# EasyEDA Pro project ProProject_ESP32C3-1.54墨水屏-多功能_2024-05-25.epro, schematic Schematic1
Create Date: 2024-04-17; Page Name: P1; Project Name: ESP32C3-1.54墨水屏-多功能; Schematic Name: Schematic1; Update Date: 2024-04-27; Company: 嘉立创EDA; Page Size: A4; Version: V1.0
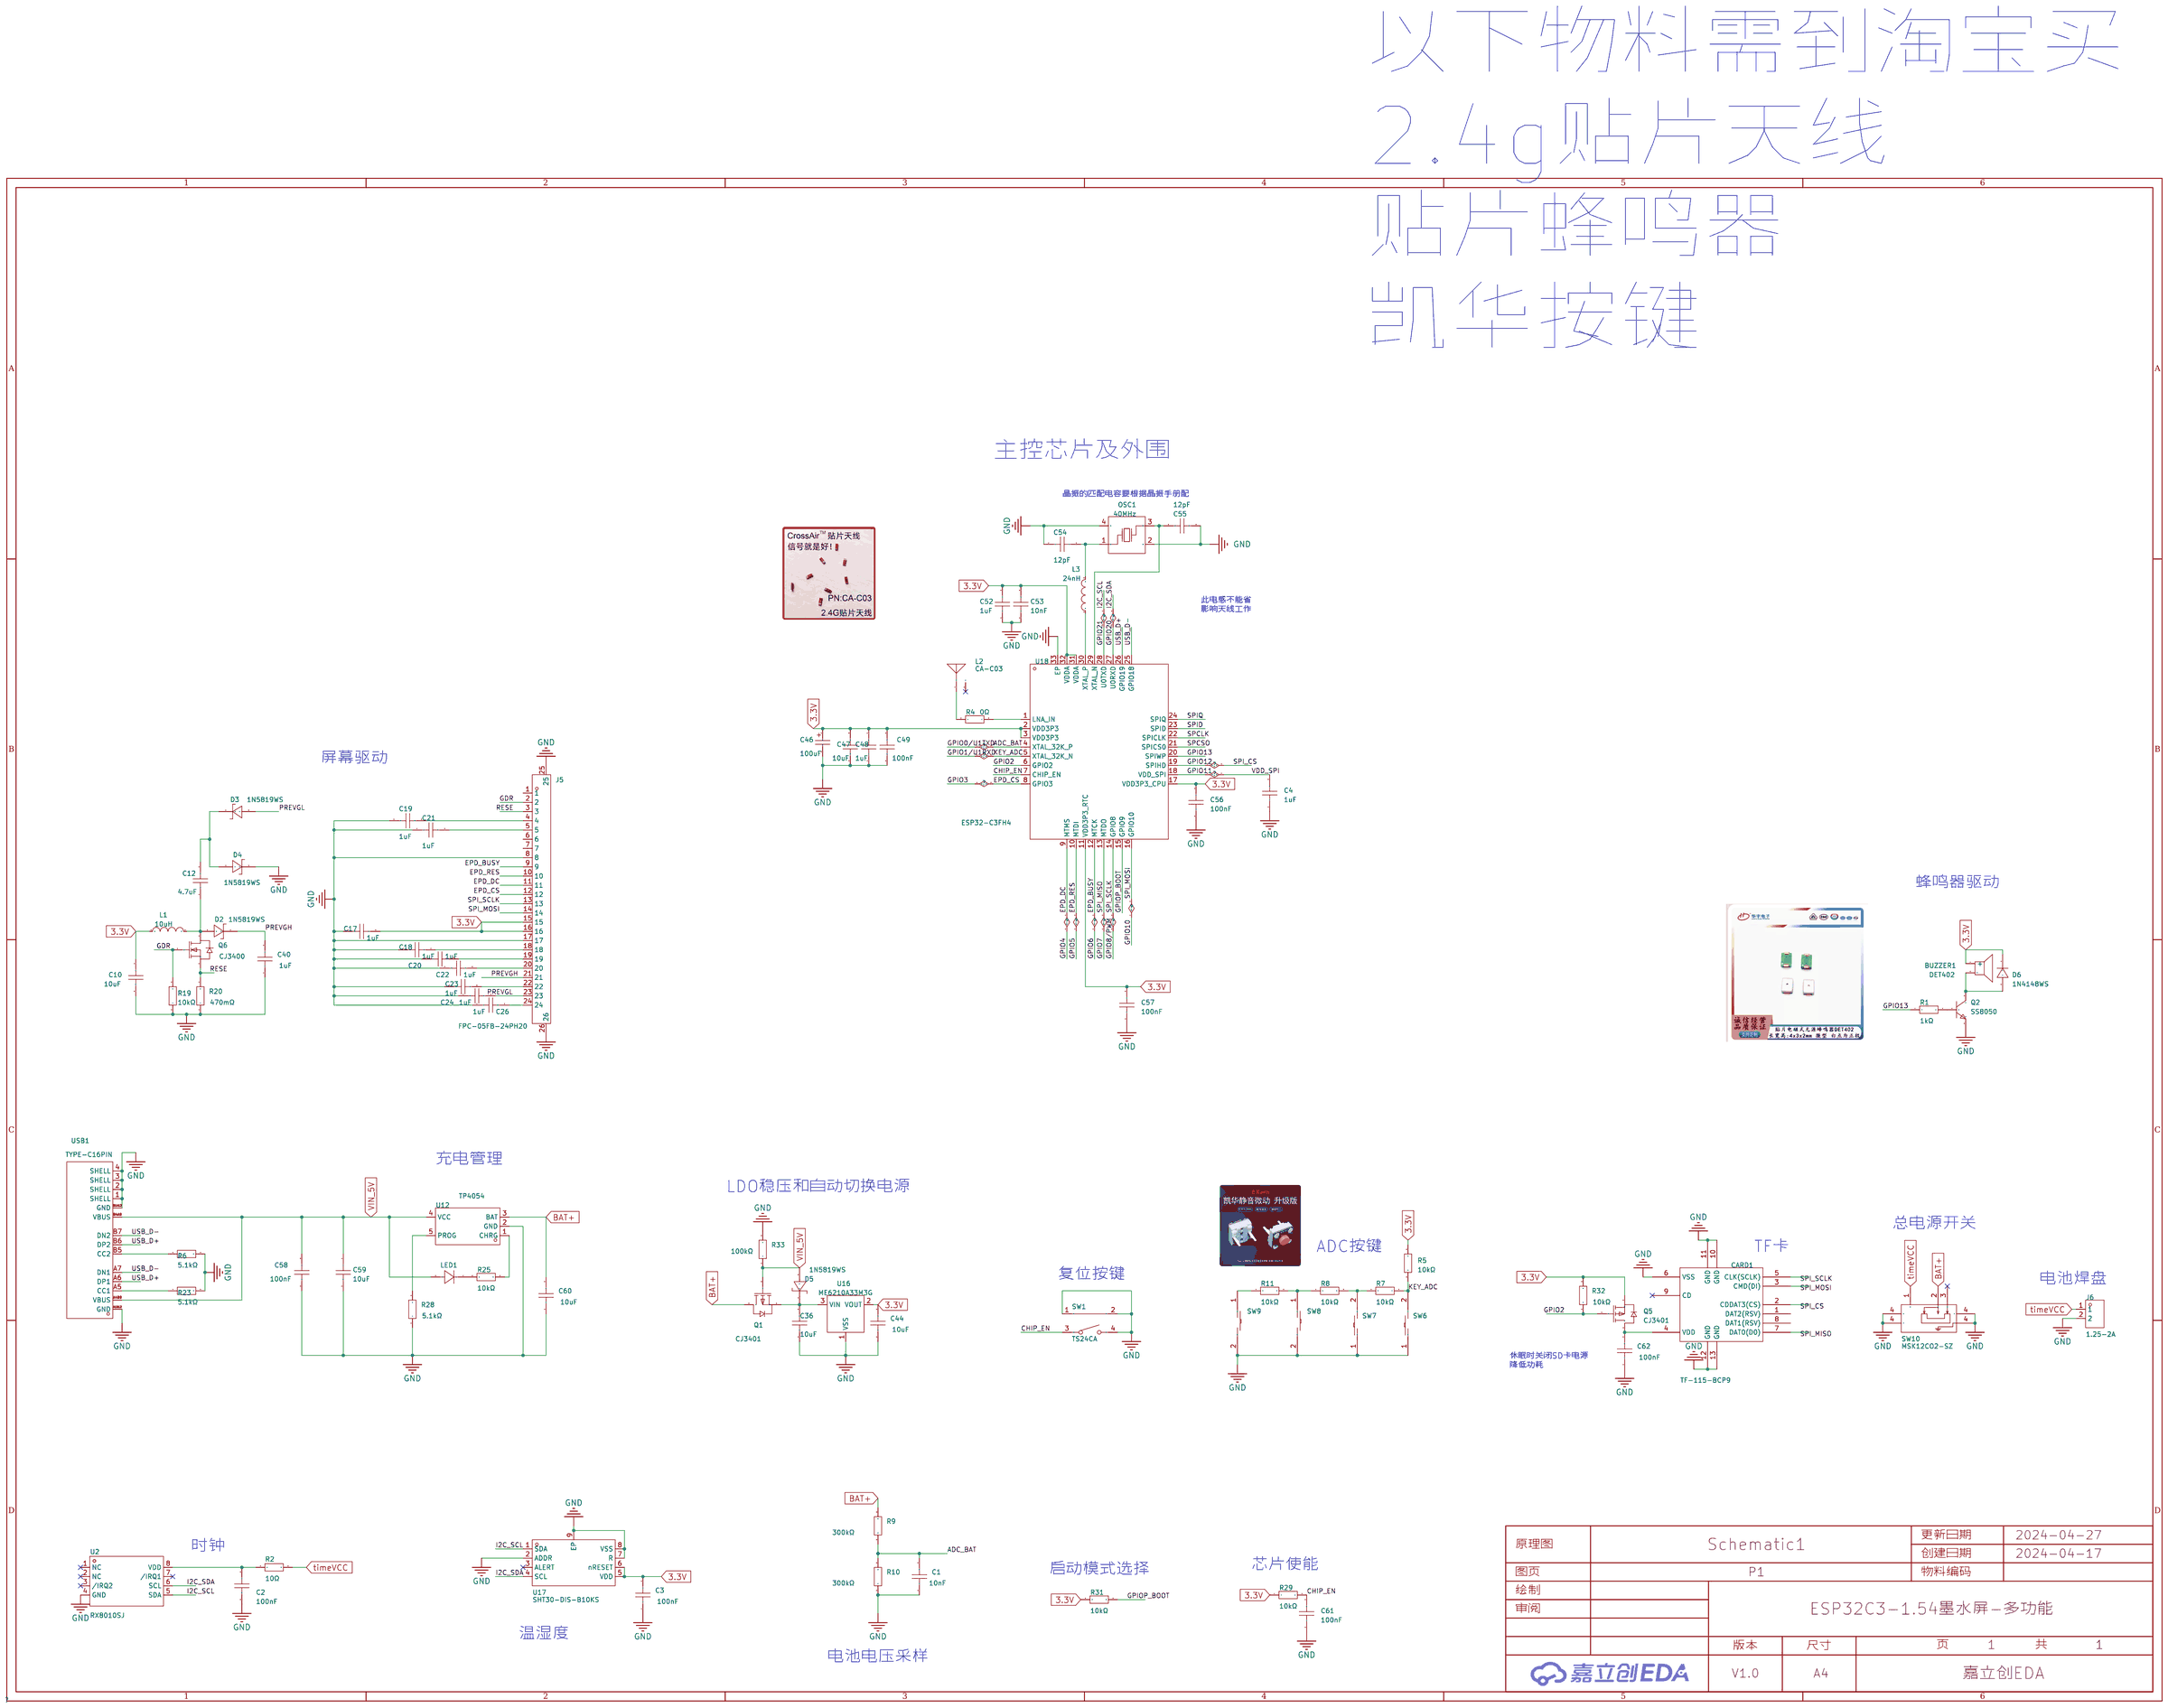
[diagram p0: schematic sheet]

## Parts
BUZZER1  DET402  [SMD404Buzzer]  (no BOM)
C1  10nF  [Capacitor_SMD:C_0603_1608Metric]
C2  100nF  [Capacitor_SMD:C_0603_1608Metric]
C3  100nF  [Capacitor_SMD:C_0603_1608Metric]
C4  1uF  [Capacitor_SMD:C_0603_1608Metric]
C10  10uF  [Capacitor_SMD:C_0603_1608Metric]
C12  4.7uF  [Capacitor_SMD:C_0603_1608Metric]
C17  1uF  [Capacitor_SMD:C_0603_1608Metric]
C18  1uF  [Capacitor_SMD:C_0603_1608Metric]
C19  1uF  [Capacitor_SMD:C_0603_1608Metric]
C20  1uF  [Capacitor_SMD:C_0603_1608Metric]
C21  1uF  [Capacitor_SMD:C_0603_1608Metric]
C22  1uF  [Capacitor_SMD:C_0603_1608Metric]
C23  1uF  [Capacitor_SMD:C_0603_1608Metric]
C24  1uF  [Capacitor_SMD:C_0603_1608Metric]
C26  1uF  [Capacitor_SMD:C_0603_1608Metric]
C36  10uF  [Capacitor_SMD:C_0603_1608Metric]
C40  1uF  [Capacitor_SMD:C_0603_1608Metric]
C44  10uF  [Capacitor_SMD:C_0603_1608Metric]
C46  100uF  [CASE-B_3528]
C47  10uF  [Capacitor_SMD:C_0603_1608Metric]
C48  1uF  [Capacitor_SMD:C_0603_1608Metric]
C49  100nF  [Capacitor_SMD:C_0603_1608Metric]
C52  1uF  [Capacitor_SMD:C_0603_1608Metric]
C53  10nF  [Capacitor_SMD:C_0603_1608Metric]
C54  12pF  [Capacitor_SMD:C_0603_1608Metric]
C55  12pF  [Capacitor_SMD:C_0603_1608Metric]
C56  100nF  [Capacitor_SMD:C_0603_1608Metric]
C57  100nF  [Capacitor_SMD:C_0603_1608Metric]
C58  100nF  [Capacitor_SMD:C_0603_1608Metric]
C59  10uF  [Capacitor_SMD:C_0603_1608Metric]
C60  10uF  [Capacitor_SMD:C_0603_1608Metric]
C61  100nF  [Capacitor_SMD:C_0603_1608Metric]
C62  100nF  [Capacitor_SMD:C_0603_1608Metric]
CARD1  TF-115-BCP9  [amy_fz:microsd]
D2  1N5819WS  [sod-323_l1.8-w1.3-ls2.5-rd]
D3  1N5819WS  [sod-323_l1.8-w1.3-ls2.5-rd]
D4  1N5819WS  [sod-323_l1.8-w1.3-ls2.5-rd]
D5  1N5819WS  [sod-323_l1.8-w1.3-ls2.5-rd]
D6  1N4148WS  [sod-323_l1.8-w1.3-ls2.5-rd]
J5  FPC-05FB-24PH20  [fpc 24p]
J6  1.25-2A  [conn-th_1.25-2a]  (no BOM)
L1  10uH  [0603]
L2  CA-C03  [ANT-SMD_L5.2-W2.0]  (no BOM)
L3  24nH  [L0402]
LED1  KT-0603W  [led0603]
OSC1  40MHz  [CRYSTAL-SMD_4P-L3.2-W2.5-BL]
Q1  CJ3401  [SOT-23-3_L2.9-W1.6-P1.90-LS2.8-BR]
Q2  SS8050  [SOT-23-3_L2.9-W1.3-P1.90-LS2.4-BR]
Q5  CJ3401  [SOT-23-3_L2.9-W1.6-P1.90-LS2.8-BR]
Q6  CJ3400  [SOT-23_L2.9-W1.3-P1.90-LS2.4-BR]
R1  1kΩ  [Resistor_SMD:R_0603_1608Metric]
R2  10Ω  [Resistor_SMD:R_0603_1608Metric]
R4  0Ω  [Resistor_SMD:R_0402_1005Metric]
R5  10kΩ  [Resistor_SMD:R_0603_1608Metric]
R6  5.1kΩ  [Resistor_SMD:R_0603_1608Metric]
R7  10kΩ  [Resistor_SMD:R_0603_1608Metric]
R8  10kΩ  [Resistor_SMD:R_0603_1608Metric]
R9  300kΩ  [Resistor_SMD:R_0603_1608Metric]
R10  300kΩ  [Resistor_SMD:R_0603_1608Metric]
R11  10kΩ  [Resistor_SMD:R_0603_1608Metric]
R19  10kΩ  [Resistor_SMD:R_0603_1608Metric]
R20  470mΩ  [Resistor_SMD:R_0603_1608Metric]
R23  5.1kΩ  [Resistor_SMD:R_0603_1608Metric]
R25  10kΩ  [Resistor_SMD:R_0603_1608Metric]
R28  5.1kΩ  [Resistor_SMD:R_0603_1608Metric]
R29  10kΩ  [Resistor_SMD:R_0603_1608Metric]
R31  10kΩ  [Resistor_SMD:R_0603_1608Metric]
R32  10kΩ  [Resistor_SMD:R_0603_1608Metric]
R33  100kΩ  [Resistor_SMD:R_0603_1608Metric]
SW1  TS24CA  [SW-SMD_TS24CA]
SW6  B3U-1000P  [卧凯华]  (no BOM)
SW7  B3U-1000P  [卧凯华]  (no BOM)
SW8  B3U-1000P  [卧凯华]  (no BOM)
SW9  B3U-1000P  [卧凯华]  (no BOM)
SW10  MSK12CO2-SZ  [SW-TH_MSK12C02]
U2  RX8010SJ  [SOP-8_L7.0方]
U12  TP4054  [TSOT-23-5_L2.9-W1.6-P0.95-LS2.8-BR]
U16  ME6210A33M3G  [SOT-23-3_L3.0-W1.7-P0.95-LS2.9-BR]
U17  SHT30-DIS-B10KS  [DFN-8_L2.5-W2.5-P0.50-BL-EP]
U18  ESP32-C3FH4  [QFN-32_L5.0-W5.0-P0.50-TL-EP3.7]
USB1  TYPE-C16PIN  [usb-c-smd_type-c16pin]

## Library data of the parts
BUZZER1 = DET402: 驱动方式:无源(外部驱动);构造类型:电磁式;频率:4kHz;声压(SPL):65dB@3V,10cm;; LCSC Part Name: 电压 3V 频率 2KHZ; Manufacturer: 华宇电子; Supplier Footprint: SMD,4x4mm; Oscillator Circuit: 无源(外部驱动); Technology Type: 电磁式; Operating Voltage: 2.5V~4.5V; Sound Pressure Level (SPL): 70dB@3V,10cm; Length: 4mm; Width: 3; Height: 2
C1 C53 = 0603B103K500NT: 容值:10nF;精度:±10%;额定电压:50V;材质(温度系数):X7R;; LCSC Part Name: 10nF ±10% 50V; Supplier Part: C57112; Manufacturer: FH(风华); Supplier Footprint: 0603; JLCPCB Part Class: Basic Part; Datasheet: https://atta.szlcsc.com/upload/public/pdf/source/20200305/C486355_26A10D38EF8C2A5C37091D0039909270.pdf; Supplier: LCSC; Tolerance: ±10%; Voltage Rated: 50V; Temperature Coefficient: X7R
C2 C3 C49 C56-C58 C61 C62 = CC0603KRX7R9BB104: 容值:100nF;精度:±10%;额定电压:50V;材质(温度系数):X7R;; LCSC Part Name: 100nF ±10% 50V; Supplier Part: C14663; Manufacturer: YAGEO(国巨); Supplier Footprint: 0603; JLCPCB Part Class: Basic Part; Datasheet: https://atta.szlcsc.com/upload/public/pdf/source/20180910/C282072_33301C7F631E79921B82A8DAC6BCC5B3.pdf; Supplier: LCSC; Tolerance: ±10%; Voltage Rated: 50V; Temperature Coefficient: X7R
C4 C17-C24 C26 C40 C48 C52 = CL10A105KB8NNNC: 容值:1uF;精度:±10%;额定电压:50V;材质(温度系数):X5R;; LCSC Part Name: 1uF ±10% 50V; Supplier Part: C15849; Manufacturer: SAMSUNG(三星); Supplier Footprint: 0603; JLCPCB Part Class: Basic Part; Datasheet: https://atta.szlcsc.com/upload/public/pdf/source/20160218/1457707763339.pdf; Supplier: LCSC; Tolerance: ±10%; Voltage Rated: 50V; Temperature Coefficient: X5R
C10 C36 C44 C47 C59 C60 = CL10A106MA8NRNC: 容值:10uF;精度:±20%;额定电压:25V;材质(温度系数):X5R;; LCSC Part Name: 10uF ±20% 25V; Supplier Part: C96446; Manufacturer: SAMSUNG(三星); Supplier Footprint: 0603; JLCPCB Part Class: Basic Part; Datasheet: https://atta.szlcsc.com/upload/public/pdf/source/20160218/1457707763339.pdf; Supplier: LCSC; Tolerance: ±20%; Voltage Rated: 25V; Temperature Coefficient: X5R
C12 = CL10A475KL8NRNC: 容值:4.7uF;精度:±10%;额定电压:35V;材质(温度系数):X5R;; LCSC Part Name: 4.7uF ±10% 35V; Supplier Part: C307467; Manufacturer: SAMSUNG(三星); Supplier Footprint: 0603; JLCPCB Part Class: Extended Part; Datasheet: https://atta.szlcsc.com/upload/public/pdf/source/20160218/1457707763339.pdf; Supplier: LCSC; Tolerance: ±10%; Voltage Rated: 35V; Temperature Coefficient: X5R; Check: true
C46 = TAJB107K006RNJ: 容值:100uF;精度:±10%;额定电压:6.3V;等效串联电阻:1.7Ω@100kHz;; LCSC Part Name: 100uF ±10% 6.3V; Supplier Part: C16133; Manufacturer: Kyocera AVX; Supplier Footprint: CASE-B-3528; JLCPCB Part Class: Basic Part; Datasheet: https://atta.szlcsc.com/upload/public/pdf/source/20160107/1457707750344.pdf; Supplier: LCSC; Tolerance: ±10%; Rated Voltage: 6.3V; Equivalent Series Resistance(ESR): 1.7Ω@100kHz; Operating Temperature: -55℃~+125℃
C54 C55 = CL10C120JB8NNNC: 容值:12pF;精度:±5%;额定电压:50V;材质(温度系数):C0G;; LCSC Part Name: 12pF ±5% 50V; Supplier Part: C38523; Manufacturer: SAMSUNG(三星); Supplier Footprint: 0603; JLCPCB Part Class: Basic Part; Datasheet: https://atta.szlcsc.com/upload/public/pdf/source/20160218/1457707763339.pdf; Supplier: LCSC; Tolerance: ±5%; Voltage Rated: 50V; Temperature Coefficient: C0G
CARD1 = TF-115-BCP9: 卡连接方式:自弹式;卡类型:MicroSD卡(TF卡);连接器类型:卡座;本体最大高度:1.8mm;触头材质:磷铜;触头镀层:锡;工作温度范围:-25℃~+85℃;焊接温度(最大值):260℃;; LCSC Part Name: 自弹式 MicroSD卡(TF卡) 卡座; Supplier Part: C720505; Manufacturer: XUNPU(讯普); Supplier Footprint: SMD; JLCPCB Part Class: Extended Part; Datasheet: https://atta.szlcsc.com/upload/public/pdf/source/20210906/DBEC8F03AA1503572333C7CF4A76D0AD.pdf; Supplier: LCSC; Card Connection Mode: 自弹式; Card Type: MicroSD卡(TF卡); Connector Type: 卡座; Maximum Body Height: 1.8mm; Contact Material: 磷铜; Contact Plating: 锡; Operating Temperature Range: -25℃~+85℃; Soldering Temperature(Max): 260℃
D2-D5 = 1N5819WS_C191023: 直流反向耐压(Vr):40V;平均整流电流(Io):1A;正向压降(Vf):600mV@1A;; LCSC Part Name: 40V 1A 600mV@1A; Supplier Part: C191023; Manufacturer: Hottech(合科泰); Supplier Footprint: SOD-323; JLCPCB Part Class: Basic Part; Datasheet: https://atta.szlcsc.com/upload/public/pdf/source/20180614/C191023_3C6A6398B911F3A4C23E7538EE054643.pdf; Supplier: LCSC; Reverse Voltage (Vr): 40V; Average Rectified Current (Io): 1A; Forward Voltage (Vf@If): 600mV@1A
D6 = 1N4148WS_C2128: 二极管配置:独立式;正向压降(Vf):1.25V@150mA;直流反向耐压(Vr):100V;平均整流电流(Io):150mA;功率:200mW;反向恢复时间(trr):4ns;; LCSC Part Name: 电压:100V 电流:150mA; Supplier Part: C2128; Manufacturer: CJ(江苏长电/长晶); Supplier Footprint: SOD-323; JLCPCB Part Class: 基础库; Datasheet: https://atta.szlcsc.com/upload/public/pdf/source/20140809/1457707208178.pdf; Supplier: LCSC; Diode Configuration: 独立式; Forward Voltage (Vf@If): 1.25V@150mA; Reverse Voltage (Vr): 100V; Average Rectified Current (Io): 150mA; Power Dissipation: 200mW; Reverse Leakage Current: 1uA@75V; Reverse Recovery Time (trr): 4ns
J5 = FPC-05FB-24PH20: 锁定特性:翻盖式;触点类型:双侧触点/上下接;触点数量:24P;间距:0.5mm;安装类型:卧贴;工作温度范围:-25℃~+85℃;; LCSC Part Name: 间距:0.5mm P数:24P 翻盖式 双侧触点/上下接; Supplier Part: C2856831; Manufacturer: XUNPU(讯普); Supplier Footprint: SMD,P=0.5mm,卧贴; JLCPCB Part Class: Extended Part; Datasheet: https://atta.szlcsc.com/upload/public/pdf/source/20210922/C2856831_717985F95873A81D5C0B7E3F2E5E5327.pdf; Supplier: LCSC; Locking Feature: 翻盖式; Contact Type: 双侧触点/上下接; Number of Contacts: 24P; Pitch: 0.5mm; Mounting Type: 卧贴; FFC, FCB Thickness: 0.3mm; Height Above Board: 2mm; Operating Temperature Range: -25℃~+85℃
J6 = 1.25-2A: LCSC Part Name: 2P 1.25mm; Supplier Part: C2829702; Manufacturer: FG(富港); Supplier Footprint: 直插,P=1.25mm; JLCPCB Part Class: Extended Part; Supplier: LCSC
L1 = MLZ1608M100WT000: 电感值:10uH;精度:±20%;额定电流:-;饱和电流(Isat):90mA;直流电阻(DCR):1.05Ω;; LCSC Part Name: 10uH ±20% 90mA; Supplier Part: C76798; Manufacturer: TDK; JLCPCB Part Class: Extended Part; Datasheet: https://atta.szlcsc.com/upload/public/pdf/source/20160918/1474166926388.pdf; Supplier: LCSC; Tolerance: ±20%; Saturation Current (Isat): 90mA; DC Resistance (DCR): 1.05Ω; Frequency - Self Resonant: 2MHz
L2 = CA-C03: Manufacturer: HWJELEC SMD贴片天线
L3 = SDCL1005C24NJTDF: 电感值:24nH;精度:±5%;额定电流:-;饱和电流(Isat):-;直流电阻(DCR):-;; LCSC Part Name: 24nH ±5%; Supplier Part: C74301; Manufacturer: Sunlord(顺络); Supplier Footprint: 0402; JLCPCB Part Class: Extended Part; Datasheet: https://atta.szlcsc.com/upload/public/pdf/source/20231027/6126A3AAC5912C34388756BE22DEE00C.pdf; Supplier: LCSC; Tolerance: ±5%
LED1 = KT-0603W: 发光颜色:白色;; LCSC Part Name: 0603 白灯 高亮; Supplier Part: C2290; Manufacturer: KENTO; Supplier Footprint: 0603; JLCPCB Part Class: Basic Part; Datasheet: https://atta.szlcsc.com/upload/public/pdf/source/20221101/4C23D5C85BA051E44A00B833D0A41468.pdf; Supplier: LCSC; Emitted Color: 白色; Forward Voltage (VF): 2.6V~3.6V; Power Dissipation: 72mW; Forward Current: 5mA; Lens Color: 雾状黄透镜; Luminous Intensity: 200mcd~300mcd; Viewing Angle: 130°; Operating Temperature: -30℃~+85℃; Mounting Type: 表面贴装; Illumination Color: 普绿/黄绿; Luminous Intensity (IF=20mA): 35mcd; Dominant Wavelength / Coordinate rank: 570nm
OSC1 = S3240000121040: 晶振类型:贴片晶振;频率:40MHz;常温频差:±10ppm;外接负载电容:12pF;; LCSC Part Name: 40MHz ±10ppm 12pF; Supplier Part: C426989; Manufacturer: JGHC(晶光华); Supplier Footprint: SMD3225-4P; JLCPCB Part Class: Extended Part; Datasheet: https://atta.szlcsc.com/upload/public/pdf/source/20191012/C431172_99BCDFC5E39E114929AE7F9C9DED2B9F.pdf; Supplier: LCSC; Crystal Type: 贴片晶振; Normal temperature Frequency Tolerance: ±10ppm; External load capacitor: 12pF; Equivalent Series Resistance (ESR): 40Ω; Operating Temperature: -40℃~+85℃; Output Type: CMOS; Supply Voltage: 1.8V~3.3V; Frequency Stability(Full temperature range): ±20ppm
Q1 Q5 = CJ3401: 类型:P沟道;漏源电压(Vdss):30V;连续漏极电流(Id):4.2A;功率(Pd):350mW;导通电阻(RDS(on)@Vgs,Id):65mΩ@10V,4.2A;; LCSC Part Name: P沟道 30V 4.2A; Supplier Part: C13799; Manufacturer: CJ(江苏长电/长晶); Supplier Footprint: SOT-23; JLCPCB Part Class: Extended Part; Datasheet: https://atta.szlcsc.com/upload/public/pdf/source/20140815/1457707217656.pdf; Supplier: LCSC; Type: P沟道; Drain Source Voltage (Vdss): 30V; Continuous Drain Current (Id): 4.2A; Power Dissipation (Pd): 350mW; Drain Source On Resistance (RDS(on)@Vgs,Id): 65mΩ@10V,4.2A; Gate Threshold Voltage (Vgs(th)@Id): 1.3V@250uA
Q2 = SS8050_C7420370: 晶体管类型:NPN;集电极电流(Ic):1.5A;集射极击穿电压(Vceo):25V;功率(Pd):300mW;直流电流增益(hFE@Ic,Vce):120@100mA,1.0V;; LCSC Part Name: 耐压:25V 电流:1.5A NPN H档 200-350; Supplier Part: C7420370; Manufacturer: 宏迦橙; Supplier Footprint: SOT-23; JLCPCB Part Class: 扩展库; Datasheet: https://atta.szlcsc.com/upload/public/pdf/source/20231222/9C4050A7669EB24B3ACD0418218817FD.pdf; Supplier: LCSC; Transistor Type: NPN; Collector Current (Ic): 1.5A; Collector-Emitter Breakdown Voltage (Vceo): 25V; Power Dissipation (Pd): 300mW; DC Current Gain (hFE@Ic,Vce): 120@100mA,1.0V; Transition Frequency (fT): 100MHz; Collector Cut-Off Current (Icbo): 100nA; Collector-Emitter Saturation Voltage (VCE(sat)@Ic,Ib): 500mV@800mA,80mA; Operating Temperature: -55℃~+150℃
Q6 = CJ3400: 类型:N沟道;漏源电压(Vdss):30V;连续漏极电流(Id):5.8A;功率(Pd):350mW;导通电阻(RDS(on)@Vgs,Id):35mΩ@10V,5.8A;阈值电压(Vgs(th)@Id):1.4V@250uA;; LCSC Part Name: N沟道 30V 5.8A; Supplier Part: C19019; Manufacturer: CJ(江苏长电/长晶); Supplier Footprint: SOT-23; JLCPCB Part Class: Extended Part; Datasheet: https://atta.szlcsc.com/upload/public/pdf/source/20140809/1457707205786.pdf; Supplier: LCSC; Type: N沟道; Drain Source Voltage (Vdss): 30V; Continuous Drain Current (Id): 5.8A; Power Dissipation (Pd): 350mW; Drain Source On Resistance (RDS(on)@Vgs,Id): 35mΩ@10V,5.8A; Gate Threshold Voltage (Vgs(th)@Id): 1.4V@250uA
R1 = 0603WAF1001T5E: 电阻类型:厚膜电阻;阻值:1kΩ;精度:±1%;功率:100mW;最大工作电压:75V;温度系数:±100ppm/℃;; LCSC Part Name: 1kΩ ±1% 100mW 厚膜电阻; Supplier Part: C21190; Manufacturer: UNI-ROYAL(厚声); Supplier Footprint: 0603; JLCPCB Part Class: Basic Part; Datasheet: https://atta.szlcsc.com/upload/public/pdf/source/20200306/C422600_1E6D84923E4A46A82E41ADD87F860B5C.pdf; Supplier: LCSC; Type: 厚膜电阻; Tolerance: ±1%; Power(Watts): 100mW; Overload Voltage (Max): 75V; Temperature Coefficient: ±100ppm/℃; Operating Temperature Range: -55℃~+155℃
R2 = 0603WAF100JT5E: 电阻类型:厚膜电阻;阻值:10Ω;精度:±1%;功率:100mW;最大工作电压:75V;温度系数:±400ppm/℃;; LCSC Part Name: 10Ω ±1% 100mW 厚膜电阻; Supplier Part: C22859; Manufacturer: UNI-ROYAL(厚声); Supplier Footprint: 0603; JLCPCB Part Class: Basic Part; Datasheet: https://atta.szlcsc.com/upload/public/pdf/source/20200306/C422600_1E6D84923E4A46A82E41ADD87F860B5C.pdf; Supplier: LCSC; Type: 厚膜电阻; Tolerance: ±1%; Power(Watts): 100mW; Overload Voltage (Max): 75V; Temperature Coefficient: ±400ppm/℃; Operating Temperature Range: -55℃~+155℃
R4 = RMC 0402 0R N: 阻值:0Ω;精度:±1%;功率:-;; LCSC Part Name: 0Ω ±1%; Supplier Part: C325377; Manufacturer: Tyohm(幸亚电阻); Supplier Footprint: 0402; JLCPCB Part Class: Extended Part; Datasheet: https://atta.szlcsc.com/upload/public/pdf/source/20190115/C325956_D27151D492FFB3C9AB4A6F14FE01F30A.pdf; Supplier: LCSC; Tolerance: ±1%
R5 R7 R8 R11 R19 R25 R29 R31 R32 = 0603WAF1002T5E: 电阻类型:厚膜电阻;阻值:10kΩ;精度:±1%;功率:100mW;最大工作电压:75V;温度系数:±100ppm/℃;; LCSC Part Name: 厚膜电阻 10kΩ ±1% 100mW; Supplier Part: C25804; Manufacturer: UNI-ROYAL(厚声); Supplier Footprint: 0603; JLCPCB Part Class: Basic Part; Datasheet: https://atta.szlcsc.com/upload/public/pdf/source/20200306/C422600_1E6D84923E4A46A82E41ADD87F860B5C.pdf; Supplier: LCSC; Type: 厚膜电阻; Tolerance: ±1%; Power(Watts): 100mW; Overload Voltage (Max): 75V; Temperature Coefficient: ±100ppm/℃; Operating Temperature Range: -55℃~+155℃
R6 R23 R28 = 0603WAF5101T5E: 电阻类型:厚膜电阻;阻值:5.1kΩ;精度:±1%;功率:100mW;最大工作电压:75V;温度系数:±100ppm/℃;; LCSC Part Name: 5.1kΩ ±1% 100mW 厚膜电阻; Supplier Part: C23186; Manufacturer: UNI-ROYAL(厚声); Supplier Footprint: 0603; JLCPCB Part Class: Basic Part; Datasheet: https://atta.szlcsc.com/upload/public/pdf/source/20200306/C422600_1E6D84923E4A46A82E41ADD87F860B5C.pdf; Supplier: LCSC; Type: 厚膜电阻; Tolerance: ±1%; Power(Watts): 100mW; Overload Voltage (Max): 75V; Temperature Coefficient: ±100ppm/℃; Operating Temperature Range: -55℃~+155℃
R9 R10 = ARG03BTC3003: 电阻类型:薄膜电阻;阻值:300kΩ;精度:±0.1%;功率:100mW;最大工作电压:75V;温度系数:±25ppm/℃;; LCSC Part Name: 薄膜电阻 300kΩ ±0.1% 100mW; Supplier Part: C335091; Manufacturer: Viking(光颉); Supplier Footprint: 0603; JLCPCB Part Class: Extended Part; Datasheet: https://atta.szlcsc.com/upload/public/pdf/source/20190816/C412422_E173BA386C6DD8245B6A88358EF9877A.pdf; Supplier: LCSC; Type: 薄膜电阻; Tolerance: ±0.1%; Power(Watts): 100mW; Overload Voltage (Max): 75V; Temperature Coefficient: ±25ppm/℃; Operating Temperature Range: -55℃~+155℃
R20 = FRL0603FR470TS: 电阻类型:厚膜电阻;阻值:470mΩ;精度:±1%;功率:100mW;最大工作电压:100V;温度系数:±300ppm/℃;; LCSC Part Name: 470mΩ ±1% 100mW 厚膜电阻; Supplier Part: C3013349; Manufacturer: FOJAN(富捷); Supplier Footprint: 0603; JLCPCB Part Class: Extended Part; Datasheet: https://atta.szlcsc.com/upload/public/pdf/source/20211221/925EC7D7225764EE0046F22065062C87.pdf; Supplier: LCSC; Type: 厚膜电阻; Tolerance: ±1%; Power(Watts): 100mW; Overload Voltage (Max): 100V; Temperature Coefficient: ±300ppm/℃; Operating Temperature Range: -55℃~+155℃
R33 = RC0603FR-07100KL: 电阻类型:厚膜电阻;阻值:100kΩ;精度:±1%;功率:100mW;最大工作电压:75V;温度系数:±100ppm/℃;; LCSC Part Name: 厚膜电阻 100kΩ ±1% 100mW; Supplier Part: C14675; Manufacturer: YAGEO(国巨); Supplier Footprint: 0603; JLCPCB Part Class: Extended Part; Datasheet: https://atta.szlcsc.com/upload/public/pdf/source/20140324/1457707028752.pdf; Supplier: LCSC; Type: 厚膜电阻; Tolerance: ±1%; Power(Watts): 100mW; Overload Voltage (Max): 75V; Temperature Coefficient: ±100ppm/℃; Operating Temperature Range: -55℃~+155℃
SW1 = TS24CA: 电路结构:单刀单掷;按钮形状:矩形按钮;安装方式:卧贴;开关长度:4.55mm;开关宽度:1.8mm;开关高度:3.5mm;触点电流:50mA;额定电压(DC):12V;带灯:-;机械寿命:-;; LCSC Part Name: 4.55*1.8*3.5mm 卧贴 轻触开关; Supplier Part: C393942; Manufacturer: SHOU HAN(首韩); Supplier Footprint: SMD; JLCPCB Part Class: Extended Part; Datasheet: https://atta.szlcsc.com/upload/public/pdf/source/20190521/C393942_591A9E318887EFA4274D34029981AD99.pdf; Supplier: LCSC; Circuit: 单刀单掷; Actuator Style: 矩形按钮; Mounting Style: 卧贴; Switch Length: 4.55mm; Switch Width: 1.8mm; Switch Height: 3.5mm; Contact Current: 50mA; Voltage Rating (DC): 12V
SW6-SW9 = B3U-1000P: 触点电流:50mA;额定电压(DC):12V;电路结构:单刀单掷;安装方式:立贴;按钮形状:圆形按钮;带灯:-;开关长度:3mm;开关宽度:2.5mm;开关高度:1.6mm;; Supplier Part: C231329; Manufacturer: 凯华; Supplier Footprint: SMD,3x2.5mm; JLCPCB Part Class: Extended Part; Datasheet: https://atta.szlcsc.com/upload/public/pdf/source/20180629/C231329_070179C33643744C5978F4F02109B85D.pdf; Supplier: LCSC; Contact Current: 50mA; Voltage Rating (DC): 12V; Circuit: 单刀单掷; Mounting Style: 立贴; Actuator Style: 圆形按钮; Switch Length: 3mm; Switch Width: 2.5mm; Switch Height: 1.6mm
SW10 = MSK12CO2-SZ: 电路结构:单刀双掷;安装方式:卧贴;开关颜色:-;额定电流(DC):50mA;额定电压(DC):12V;额定电流(AC):-;额定电压(AC):-;机械寿命:1万次;; LCSC Part Name: 迷你贴片拨动/两档侧拨 7脚 白柄，柄长1.5mm,耐温，高品质带金属丝; Supplier Part: C2681568; Manufacturer: SHOU HAN(首韩); Supplier Footprint: SMD; JLCPCB Part Class: 扩展库; Datasheet: https://atta.szlcsc.com/upload/public/pdf/source/20190925/C431540_89155AEF0758B9AD1B2D805F83FB12E3.pdf; Supplier: LCSC; Circuit: 单刀双掷; Pin Style: SMD接片; Switch Length: 8mm; Switch Width: 2.8mm; Switch Height: 1.4mm; Mounting Style: 卧贴; Current Rating (DC): 50mA; Voltage Rating (DC): 12V; Mechanical Life: 1万次; Operating Temperature: -20℃~+70℃
U2 = RX8010SJ: 接口:I2C;工作电压:1.6V~5.5V;; LCSC Part Name: RX8010SJ(X1B000242000100); Supplier Part: C91734; Manufacturer: EPSON(爱普生); Supplier Footprint: SOP-8; JLCPCB Part Class: Extended Part; Datasheet: https://atta.szlcsc.com/upload/public/pdf/source/20170919/C91734_1505787429830977322.pdf; Supplier: LCSC; Interface: I2C; Operating Voltage: 1.6V~5.5V
U12 = TP4054_C668215: 电源电压:6.5V;最大充电电流:500mA;电池类型:锂离子/聚合物;电池节数:1;; Supplier Part: C668215; Manufacturer: UMW(友台半导体); Supplier Footprint: SOT-23-5L; JLCPCB Part Class: Extended Part; Datasheet: https://atta.szlcsc.com/upload/public/pdf/source/20231109/1E60770826C4E1A0E5898BBC08FF3A57.pdf; Supplier: LCSC; Supply Voltage: 6.5V; Maximum Charge Current: 500mA; Type of Battery: 锂离子/聚合物; Number of Cells: 1; Operating Temperature: -40℃~+85℃
U16 = ME6210A33M3G: 输出类型:固定;输出极性:正;最大输入电压:18V;输出电压:3.3V;输出电流:500mA;电源纹波抑制比(PSRR):-;; LCSC Part Name: 正 Vin=18V Vout=3.3V 500mA; Supplier Part: C236680; Manufacturer: MICRONE(南京微盟); Supplier Footprint: SOT-23; JLCPCB Part Class: Extended Part; Datasheet: https://atta.szlcsc.com/upload/public/pdf/source/20180709/C236680_4A9EFC836B6D96276770F83E6DC5A093.pdf; Supplier: LCSC; Output Type: 固定; Output Polarity: 正; Number of Outputs: 1; Maximum Input Voltage: 18V; Output Voltage: 3.3V; Dropout Voltage: 260mV@(200mA); Output Current: 500mA
U17 = SHT30-DIS-B10KS: 立创商城  C77361  可替换，两者仅包装不一样。; LCSC Part Name: SHT30-DIS; Supplier Part: C2687423; Manufacturer: Sensirion(瑞士盛思锐); Supplier Footprint: DFN-8-EP(2.5x2.5); JLCPCB Part Class: Extended Part; Datasheet: https://atta.szlcsc.com/upload/public/pdf/source/20210120/C2687423_31DB3FACC3E95675626B9DEF500B4777.pdf; Supplier: LCSC
U18 = ESP32-C3FH4: CPU内核:RISC-V;RAM总容量:400KB;GPIO端口数量:22;工作电压范围:3V~3.6V;CPU最大主频:160MHz;程序存储器类型:-;; Supplier Part: C2858491; Manufacturer: ESPRESSIF(乐鑫); Supplier Footprint: QFN-32-EP(5x5); JLCPCB Part Class: Extended Part; Datasheet: https://atta.szlcsc.com/upload/public/pdf/source/20231220/86199E4714F7A99F6AA9401EA48CDBDA.pdf; Supplier: LCSC; CPU Core: RISC-V; RAM Size: 400KB; GPIO Ports Number: 22; Operating Voltage Range: 3V~3.6V; CPU Maximum Speed: 160MHz; Operating Temperature Range: -40℃~+105℃; ADC (Bit): 12bit; UART/USART: 2; I2C: 1; I2S: 1; SPI: 3; Peripheral/Function: 蓝牙协议栈；片载温度传感器；真随机数发生器；DMA；看门狗；WIFI协议栈；硬件密码算法引擎；54位Timer；PWM；RTC实时时钟; communication protocol: 蓝牙协议；WIFI协议; Watchdog: 有; Real-Time Clock: 有; Direct Memory Access: 有
USB1 = TYPE-C16PIN: 连接器类型:Type-C;标准:-;公母:母座;触点数量:16;端口数量:1;安装方式:卧贴;额定电流 - 电源:3A;工作温度范围:-40℃~+85℃;; Supplier: LCSC; Supplier Part: C393939; Manufacturer: SHOU HAN(首韩); JLCPCB Part Class: Extended Part; LCSC Part Name: Type-C 母座 卧贴 快充闪充 停产; Supplier Footprint: SMD; Datasheet: https://atta.szlcsc.com/upload/public/pdf/source/20190521/C393939_7B9043D4CF1026AF443AB60D91FBCD5C.pdf; Connector Type: Type-C; Gender: 母座; Number of Ports: 1; Number of Contacts: 16; Mounting Style: 卧贴; Current Rating - Power (Max): 3A; Operating Temperature Range: -40℃~+85℃; NO_CONNECT: yes

## Nets
3.3V: BUZZER1.1(+) C3.2 C10.1 C17.2 C44.2 C46.1 C47.2 C48.2 C49.2 C52.2 C53.2 C56.1 C57.2 D6.1(K) J5.15 J5.16 L1.1 Q5.2(S) R5.2 R29.1 R31.1 R32.2 U16.2(VOUT) U17.5(VDD) U17.6(nRESET) U18.2(VDD3P3) U18.3(VDD3P3) U18.11(VDD3P3_RTC) U18.17(VDD3P3_CPU) U18.31(VDDA) U18.32(VDDA)
GND: C1.1 C2.1 C3.1 C4.1 C10.2 C17.1 C18.1 C19.1 C20.1 C21.1 C22.1 C23.1 C24.1 C26.1 C36.1 C40.1 C44.1 C46.2 C47.1 C48.1 C49.1 C52.1 C53.1 C54.1 C55.2 C56.2 C57.1 C58.1 C59.2 C60.1 C61.1 C62.1 CARD1.6(VSS) CARD1.10(GND) CARD1.11(GND) CARD1.12(GND) CARD1.13(GND) D4.1(C) J5.8 J5.17 J5.25 J5.26 J6.2 OSC1.2(GND) OSC1.4(GND) Q2.2(E) R6.2 R10.1 R19.1 R20.1 R23.2 R28.1 R33.2 SW1.1 SW1.2 SW1.4 SW6.1 SW7.1 SW8.2 SW9.2 SW10.4 U2.4(GND) U12.2(GND) U16.1(VSS) U17.2(ADDR) U17.7(R) U17.8(VSS) U17.9(EP) U18.33(EP) USB1.1(SHELL) USB1.2(SHELL) USB1.3(SHELL) USB1.4(SHELL) USB1.A1B12(GND) USB1.B1A12(GND)
VIN_5V: C58.2 C59.1 D5.2(A) LED1.2(A) Q1.1(G) R33.1 U12.4(VCC) USB1.A4B9(VBUS) USB1.B4A9(VBUS)
ADC_BAT: C1.2 R9.1 R10.2 U18.4(XTAL_32K_P)
BAT+: C60.2 Q1.3(D) R9.2 SW10.2 U12.3(BAT)
CHIP_EN: C61.2 R29.2 SW1.3 U18.7(CHIP_EN)
EPD_BUSY: J5.9 U18.12(MTCK)
EPD_CS: J5.12 U18.8(GPIO3)
EPD_DC: J5.11 U18.9(MTMS)
EPD_RES: J5.10 U18.10(MTDI)
GDR: J5.2 Q6.1(G) R19.2
GPIO1/U1RXD: R5.1 R7.2 SW6.2 U18.5(XTAL_32K_N)
GPIO2: Q5.1(G) R32.1 U18.6(GPIO2)
GPIO7: CARD1.7(DAT0(D0)) U18.13(MTDO)
GPIO8/PWM: CARD1.5(CLK(SCLK)) J5.13 U18.14(GPIO8)
GPIO10: CARD1.3(CMD(DI)) J5.14 U18.16(GPIO10)
GPIO11: C4.2 U18.18(VDD_SPI)
GPIO12: CARD1.2(CDDAT3(CS)) U18.19(SPIHD)
GPIO13: R1.1 U18.20(SPIWP)
GPIO20: U2.6(SCL) U17.4(SCL) U18.27(U0RXD)
GPIO21: U2.5(SDA) U17.1(SDA) U18.28(U0TXD)
GPIOP_BOOT: R31.2 U18.15(GPIO9)
PREVGH: C40.2 D2.1(C) J5.21
PREVGL: C24.2 D3.2(A) J5.23
RESE: J5.3 Q6.2(S) R20.2
SPCLK: U18.22(SPICLK)
SPCSO: U18.21(SPICS0)
SPID: U18.23(SPID)
SPIQ: U18.24(SPIQ)
timeVCC: J6.1 R2.2 SW10.1
USB_D+: U18.26(GPIO19) USB1.A6(DP1) USB1.B6(DP2)
USB_D-: U18.25(GPIO18) USB1.A7(DN1) USB1.B7(DN2)
$1N1430: R6.1 USB1.B5(CC2)
$1N1433: R23.1 USB1.A5(CC1)
$1N1643: C36.2 D5.1(C) Q1.2(S) U16.3(VIN)
$1N2213: C2.2 R2.1 U2.8(VDD)
$1N9944: C12.2 D3.1(C) D4.2(A)
$1N9952: C12.1 D2.2(A) L1.2 Q6.3(D)
$1N9961: C19.2 J5.4
$1N9962: C21.2 J5.5
$1N9965: C26.2 J5.24
$1N9981: C23.2 J5.22
$1N9982: C22.2 J5.20
$1N9983: C20.2 J5.19
$1N9984: C18.2 J5.18
$1N10003: C62.2 CARD1.4(VDD) Q5.3(D)
$1N10008: R11.1 SW9.1
$1N10009: R8.1 R11.2 SW8.1
$1N10010: R7.1 R8.2 SW7.2
$1N10078: C55.1 OSC1.3(OSC2) U18.29(XTAL_N)
$1N10086: R4.2 U18.1(LNA_IN)
$1N10087: L2.1(ANT) R4.1
$1N10089: BUZZER1.2 D6.2(A) Q2.3(C)
$1N10090: Q2.1(B) R1.2
$1N10110: L3.1 U18.30(XTAL_P)
$1N10113: C54.2 L3.2 OSC1.1(OSC1)
$1N15185: R28.2 U12.5(PROG)
$1N15189: R25.1 U12.1(CHRG)
$1N17707: LED1.1(K) R25.2

Not connected (* = marked no-connect by the designer): CARD1 1(DAT2(RSV)) 8(DAT1(RSV)) 9(CD)*; J5 1 6 7; L2 2*; SW10 3*; U2 1(NC)* 2(NC)* 3(/IRQ2)* 7(/IRQ1)*; U17 3(ALERT)*

## Notes on the sheet
- 以下物料需到淘宝买
  2.4g贴片天线
  贴片蜂鸣器
  凯华按键
- 主控芯片及外围
- 晶振的匹配电容要根据晶振手册配
- 此电感不能省
  影响天线工作
- 屏幕驱动
- 蜂鸣器驱动
- 充电管理
- LDO稳压和自动切换电源
- 总电源开关
- ADC按键
- TF卡
- 复位按键
- 电池焊盘
- 休眠时关闭SD卡电源
  降低功耗
- 时钟
- 芯片使能
- 启动模式选择
- 温湿度
- 电池电压采样
